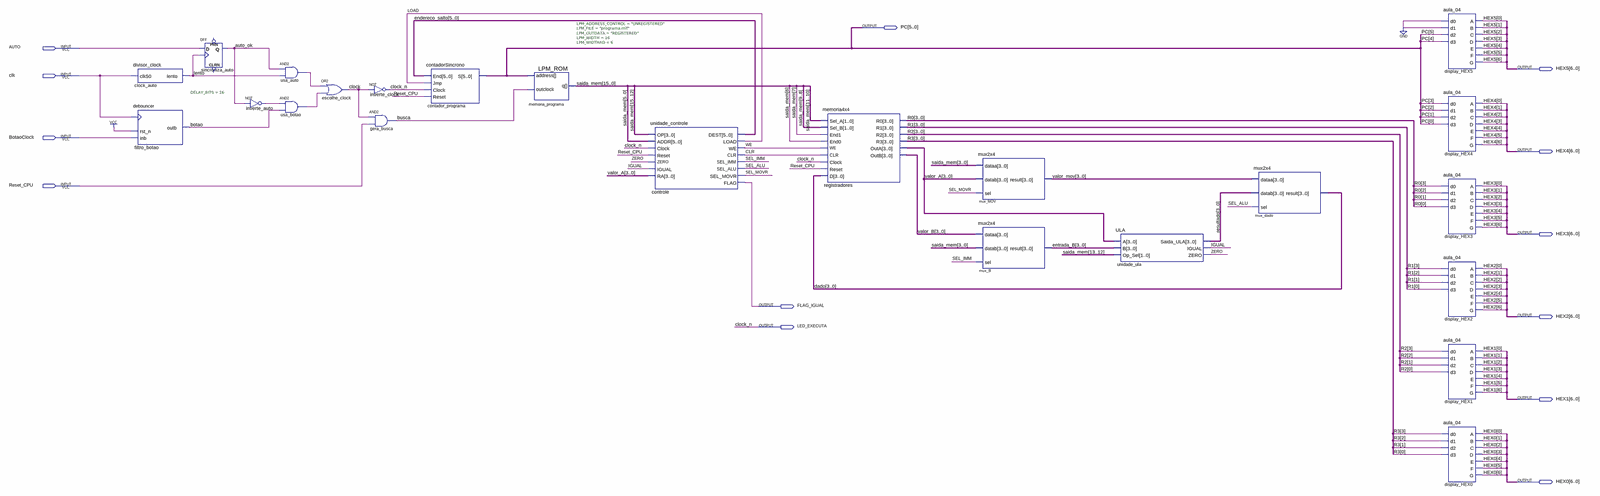
[diagram p0: schematic sheet, whole]
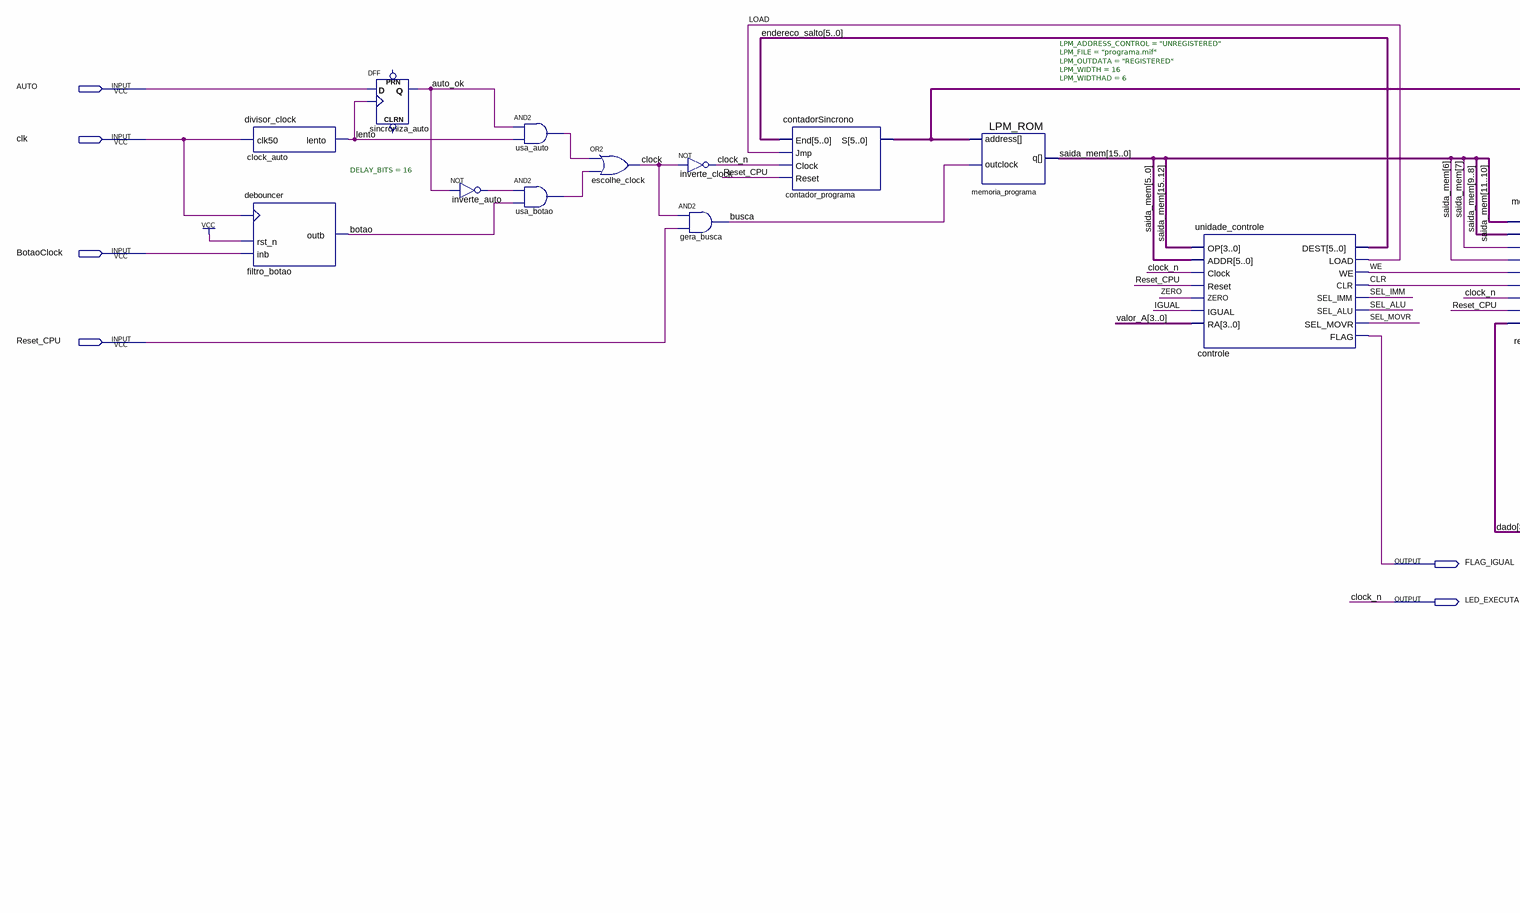
[diagram p1: schematic sheet, left part]
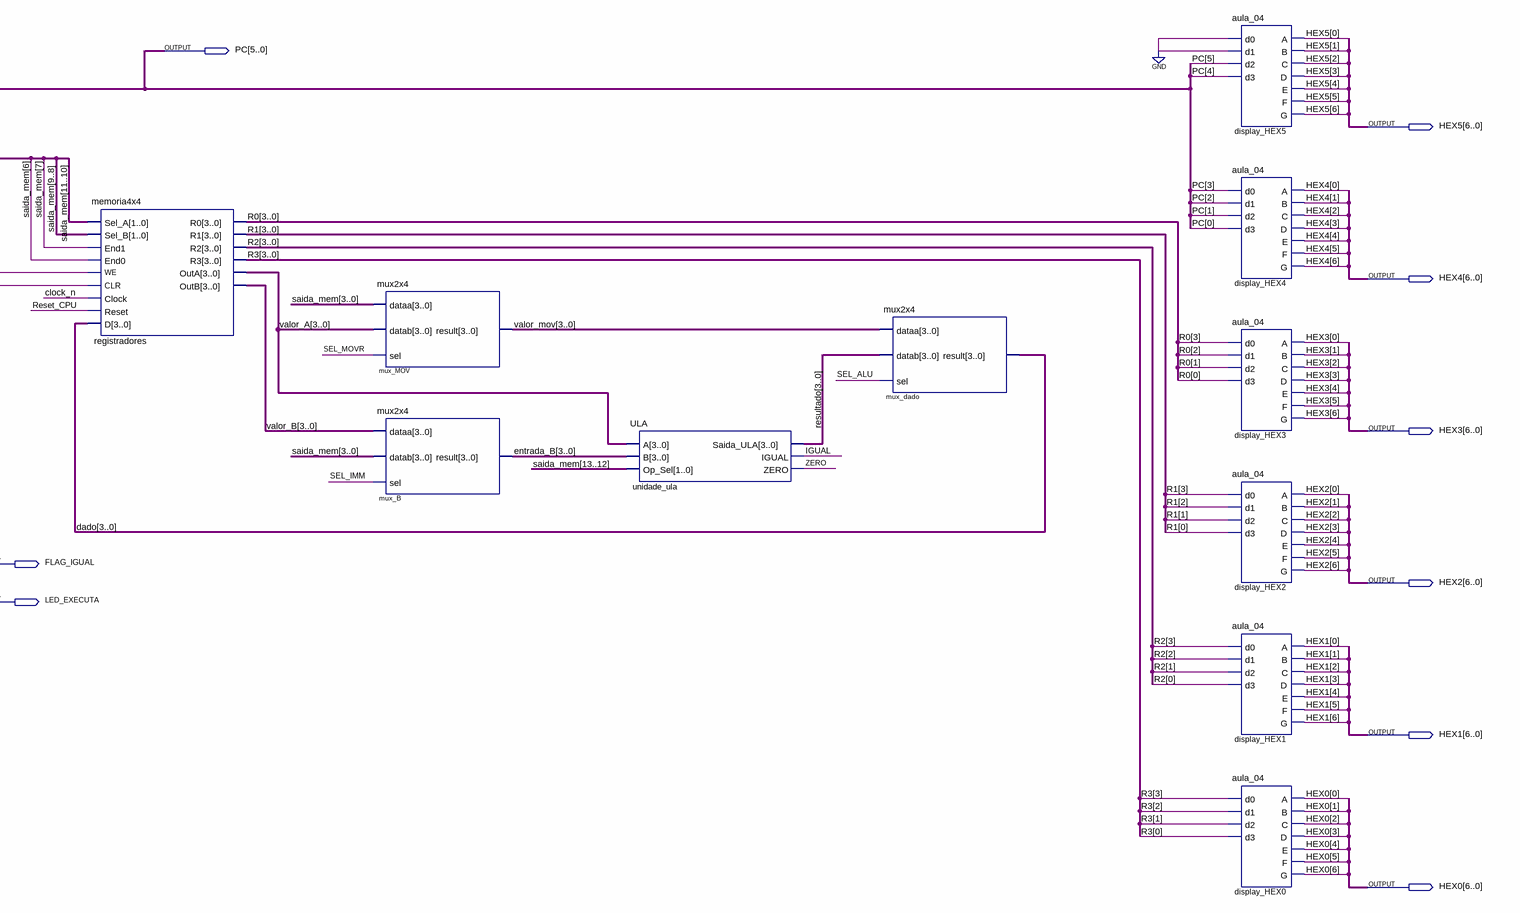
[diagram p2: schematic sheet, right part]
// Quartus schematic cpu.bdf as structural Verilog: 23 symbols, 13 pins
module cpu (
  input  AUTO,
  input  clk,
  input  BotaoClock,
  input  Reset_CPU,
  output [5:0] PC,
  output [6:0] HEX5,
  output [6:0] HEX4,
  output [6:0] HEX3,
  output FLAG_IGUAL,
  output [6:0] HEX2,
  output LED_EXECUTA,
  output [6:0] HEX1,
  output [6:0] HEX0
);

  wire auto_ok, botao, busca, clock, CLR, IGUAL, inverte_auto_out, lento, LOAD, SEL_ALU, SEL_IMM, SEL_MOVR,
       usa_auto_out, usa_botao_out, WE, ZERO;
  wire [3:0] dado, entrada_B, R0, R1, R2, R3, resultado, valor_A, valor_B, valor_mov;
  wire [5:0] endereco_salto;
  wire [15:0] saida_mem;

  divisor_clock clock_auto (.clk50(clk), .lento(lento));
  debouncer #(.DELAY_BITS(16)) filtro_botao (.rst_n(1'b1), .inb(BotaoClock), .clk(clk), .outb(botao));
  DFF sincroniza_auto (.CLK(lento), .D(AUTO), .Q(auto_ok));  // open: CLRN, PRN
  not inverte_auto (inverte_auto_out, auto_ok);
  and usa_auto (usa_auto_out, auto_ok, lento);
  and usa_botao (usa_botao_out, inverte_auto_out, botao);
  or escolhe_clock (clock, usa_auto_out, usa_botao_out);
  not inverte_clock (LED_EXECUTA, clock);
  and gera_busca (busca, clock, Reset_CPU);
  contadorSincrono contador_programa (.End(endereco_salto), .Jmp(LOAD), .Clock(LED_EXECUTA), .Reset(Reset_CPU), .S(PC));
  LPM_ROM #(.LPM_ADDRESS_CONTROL("UNREGISTERED"), .LPM_FILE("programa.mif"), .LPM_OUTDATA("REGISTERED"), .LPM_WIDTH(16), .LPM_WIDTHAD(6)) memoria_programa (
    .address(PC), .outclock(busca), .q(saida_mem));
  unidade_controle controle (
    .OP(saida_mem[15:12]), .ADDR(saida_mem[5:0]), .Clock(LED_EXECUTA), .Reset(Reset_CPU), .ZERO(ZERO),
    .IGUAL(IGUAL), .RA(valor_A), .DEST(endereco_salto), .LOAD(LOAD), .WE(WE), .CLR(CLR), .SEL_IMM(SEL_IMM),
    .SEL_ALU(SEL_ALU), .SEL_MOVR(SEL_MOVR), .FLAG(FLAG_IGUAL));
  memoria4x4 registradores (
    .Sel_A(saida_mem[11:10]), .Sel_B(saida_mem[9:8]), .End1(saida_mem[7]), .End0(saida_mem[6]), .WE(WE),
    .CLR(CLR), .Clock(LED_EXECUTA), .Reset(Reset_CPU), .D(dado), .R0(R0), .R1(R1), .R2(R2), .R3(R3),
    .OutA(valor_A), .OutB(valor_B));
  mux2x4 mux_MOV (.dataa(saida_mem[3:0]), .datab(valor_A), .sel(SEL_MOVR), .result(valor_mov));
  mux2x4 mux_B (.dataa(valor_B), .datab(saida_mem[3:0]), .sel(SEL_IMM), .result(entrada_B));
  ULA unidade_ula (
    .A(valor_A), .B(entrada_B), .Op_Sel(saida_mem[13:12]), .Saida_ULA(resultado), .IGUAL(IGUAL), .ZERO(ZERO));
  mux2x4 mux_dado (.dataa(valor_mov), .datab(resultado), .sel(SEL_ALU), .result(dado));
  aula_04 display_HEX5 (
    .d0(1'b0), .d1(1'b0), .d2(PC[5]), .d3(PC[4]), .A(HEX5[0]), .B(HEX5[1]), .C(HEX5[2]), .D(HEX5[3]),
    .E(HEX5[4]), .F(HEX5[5]), .G(HEX5[6]));
  aula_04 display_HEX4 (
    .d0(PC[3]), .d1(PC[2]), .d2(PC[1]), .d3(PC[0]), .A(HEX4[0]), .B(HEX4[1]), .C(HEX4[2]), .D(HEX4[3]),
    .E(HEX4[4]), .F(HEX4[5]), .G(HEX4[6]));
  aula_04 display_HEX3 (
    .d0(R0[3]), .d1(R0[2]), .d2(R0[1]), .d3(R0[0]), .A(HEX3[0]), .B(HEX3[1]), .C(HEX3[2]), .D(HEX3[3]),
    .E(HEX3[4]), .F(HEX3[5]), .G(HEX3[6]));
  aula_04 display_HEX2 (
    .d0(R1[3]), .d1(R1[2]), .d2(R1[1]), .d3(R1[0]), .A(HEX2[0]), .B(HEX2[1]), .C(HEX2[2]), .D(HEX2[3]),
    .E(HEX2[4]), .F(HEX2[5]), .G(HEX2[6]));
  aula_04 display_HEX1 (
    .d0(R2[3]), .d1(R2[2]), .d2(R2[1]), .d3(R2[0]), .A(HEX1[0]), .B(HEX1[1]), .C(HEX1[2]), .D(HEX1[3]),
    .E(HEX1[4]), .F(HEX1[5]), .G(HEX1[6]));
  aula_04 display_HEX0 (
    .d0(R3[3]), .d1(R3[2]), .d2(R3[1]), .d3(R3[0]), .A(HEX0[0]), .B(HEX0[1]), .C(HEX0[2]), .D(HEX0[3]),
    .E(HEX0[4]), .F(HEX0[5]), .G(HEX0[6]));

  // Other names for the same wires on the sheet: clock_n = LED_EXECUTA
endmodule
